# Altium schematic sheet ChargeBlock.SchDoc
size 420 x 297 mm; PageSetup: Record=PageOptions|CenterHorizontal=True|CenterVertical=True|PrintScale=0.94|XCorrection=1.00|YCorrection=1.00|PrintKind=1|BorderSize=5000000|LeftOffset=0|BottomOffset=0|Orientation=1|PaperLength=1000|PaperWidth=1000|Scale=100|PaperSource=7|PrintQuality=-4|MediaType=1|DitherType=10|PaperKind=A4|PrintScaleMode=1; DecimalNumber: 334115.001Э3; Name: Игровая консоль; Address1: Address1; Address2: Address2; Address3: Address3; Address4: Address4; SheetNumber: 1; SheetTotal: 2; Scale: 1:1; Разраб.: Навумчик; Обозначение документа: ВУКО.467419.001Э3; Наименование организации: ООО "VYKO"; Наименование изделия 1: Space Invaders; Наименование изделия 2: Схема электрическая; Наименование изделия 3: принципиальная; Нач. отд.: Нач. отд.
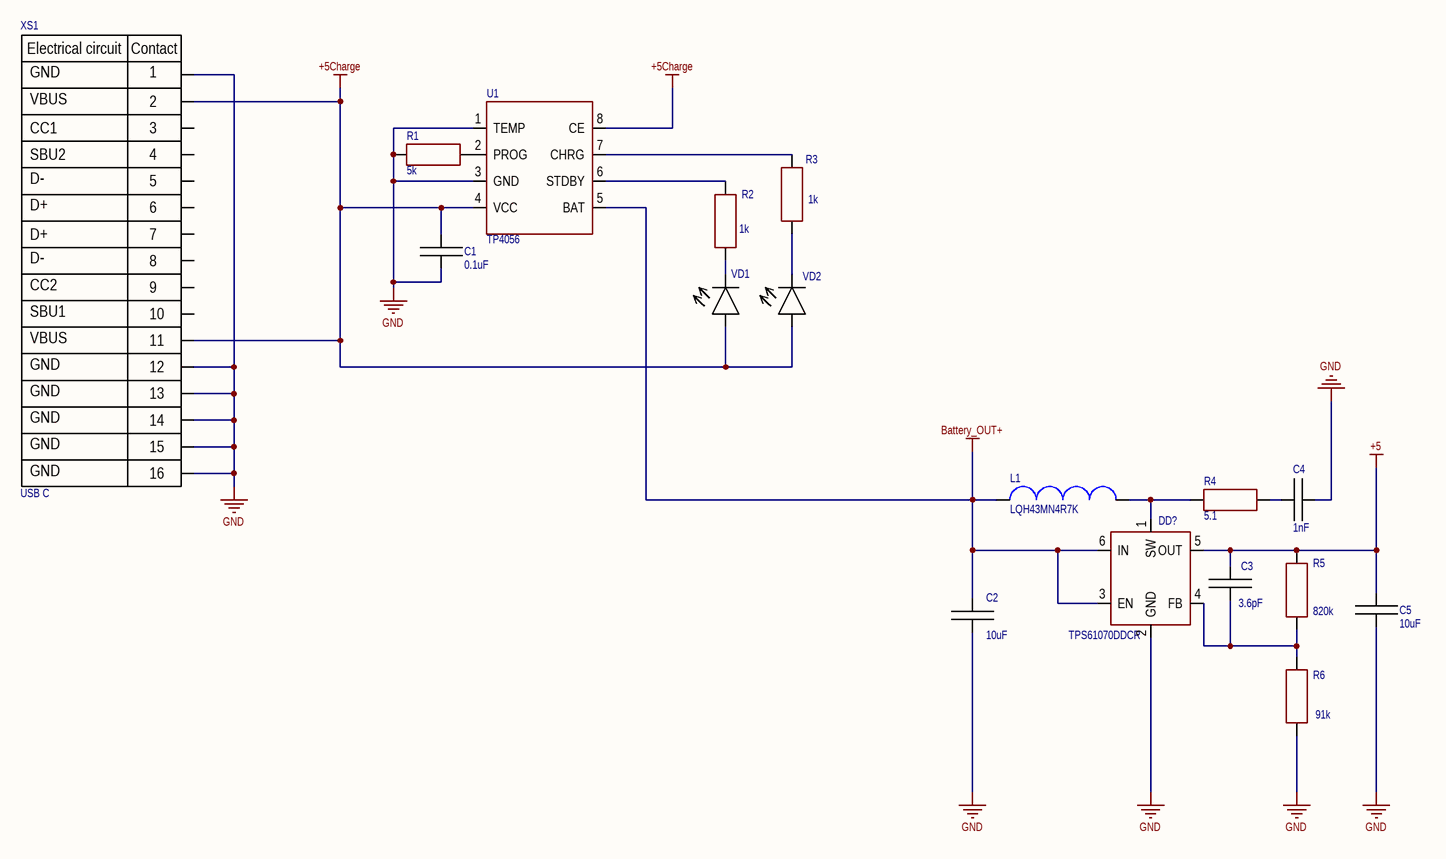
[diagram p0: ChargeBlock.SchDoc]

## Parts
C1  0.1uF  [Cap 0603]
C2  10uF  [Cap 0603]
C3  3.6pF  [Cap 0603]
C4  1nF  [Cap 0603]
C5  10uF  [Cap 0603]
DD?  TPS61070DDCR  [SOT23-6]
L1  LQH43MN4R7K  [LQH43M]
R1  5k  [Resistor 0603]
R2  1k  [Resistor 0603]
R3  1k  [Resistor 0603]
R4  5.1  [Resistor 0603]
R5  820k  [Resistor 0603]
R6  91k  [Resistor 0603]
U1  TP4056  [SOP8]
VD1  LED 0603  [VD0603]  (value not drawn)
VD2  LED 0603  [VD0603]  (value not drawn)
XS1  USB C  [USB C 16]

## Nets
+5: C3.2 C5.1 DD?.5(OUT) R5.1
+5Charge: C1.2 U1.4(VCC) U1.8(CE) VD1.1(+) VD2.1(+) XS1.2(VBUS) XS1.11(VBUS)
Battery_OUT+: C2.2 DD?.3(EN) DD?.6(IN) L1.1 U1.5(BAT)
GND: C1.1 C2.1 C4.2 C5.2 DD?.2(GND) R1.1 R6.2 U1.1(TEMP) U1.3(GND) XS1.1(GND) XS1.12(GND) XS1.13(GND) XS1.14(GND) XS1.15(GND) XS1.16(GND)
NetC3_1: C3.1 DD?.4(FB) R5.2 R6.1
NetC4_1: C4.1 R4.2
NetDD?_1: DD?.1(SW) L1.2 R4.1
NetR1_2: R1.2 U1.2(PROG)
NetR2_1: R2.1 U1.6(STDBY)
NetR2_2: R2.2 VD1.2(-)
NetR3_1: R3.1 U1.7(CHRG)
NetR3_2: R3.2 VD2.2(-)

Not connected (* = marked no-connect by the designer): XS1 3(CC1) 4(SBU2) 5(D-) 6(D+) 7(D+) 8(D-) 9(CC2) 10(SBU1)

## Notes on the sheet
- Перв. примен.
- Справ. №
- Подп. и дата
- Инв. № дубл.
- Взам. инв. №
- Разраб.
- Изм.
- Лист
- № докум.
- Подп.
- Дата
- Лит.
- Масса
- Масштаб
- Пров.
- Т.контр.
- Листов
- Инв. № подл.
- Утв.
- Н.контр.
- Копировал
- Формат А3
- (in symbol USB C 16) Electrical circuit; Contact

## Library data of the parts
C1-C5 = Capacitor: Manufacturer: *; Part Number: *; Tolerance: *; Voltage Rating: *; Dielectric: *
L1 = Inductor
R1-R6 = Resistor: SMD 0402-0805; Manufacturer: *; Part number: *; Tolerance: *; Package: *
XS1 = USB C 16